# Altium schematic sheet Top-Sheet.SchDoc
size A4; SheetNumber: 1; SheetTotal: 3
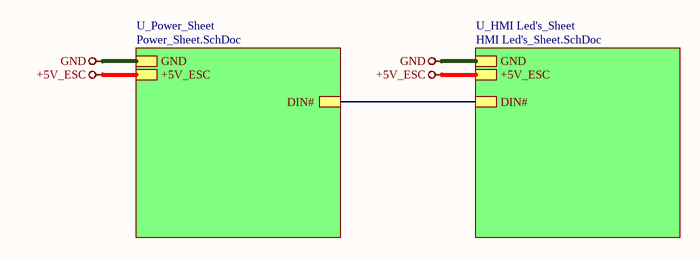
[diagram p0: Top-Sheet.SchDoc]

## Sub-sheets
U_HMI Led's_Sheet = HMI Led's_Sheet.SchDoc: GND, +5V_ESC, DIN#
U_Power_Sheet = Power_Sheet.SchDoc: GND, +5V_ESC, DIN#

## Nets
+5V_ESC: sheet U_Power_Sheet/+5V_ESC, sheet U_HMI Led's_Sheet/+5V_ESC
GND: sheet U_Power_Sheet/GND, sheet U_HMI Led's_Sheet/GND
(unnamed): sheet U_Power_Sheet/DIN#, sheet U_HMI Led's_Sheet/DIN#

## Notes on the sheet
- File:
- Title:
- Date:
- Page
- Num:
- Total:
- Drawn By: Huzaifa Ali